# Altium project MOSFET_Four_nodes_network.PrjPcb (part 1 of 2)
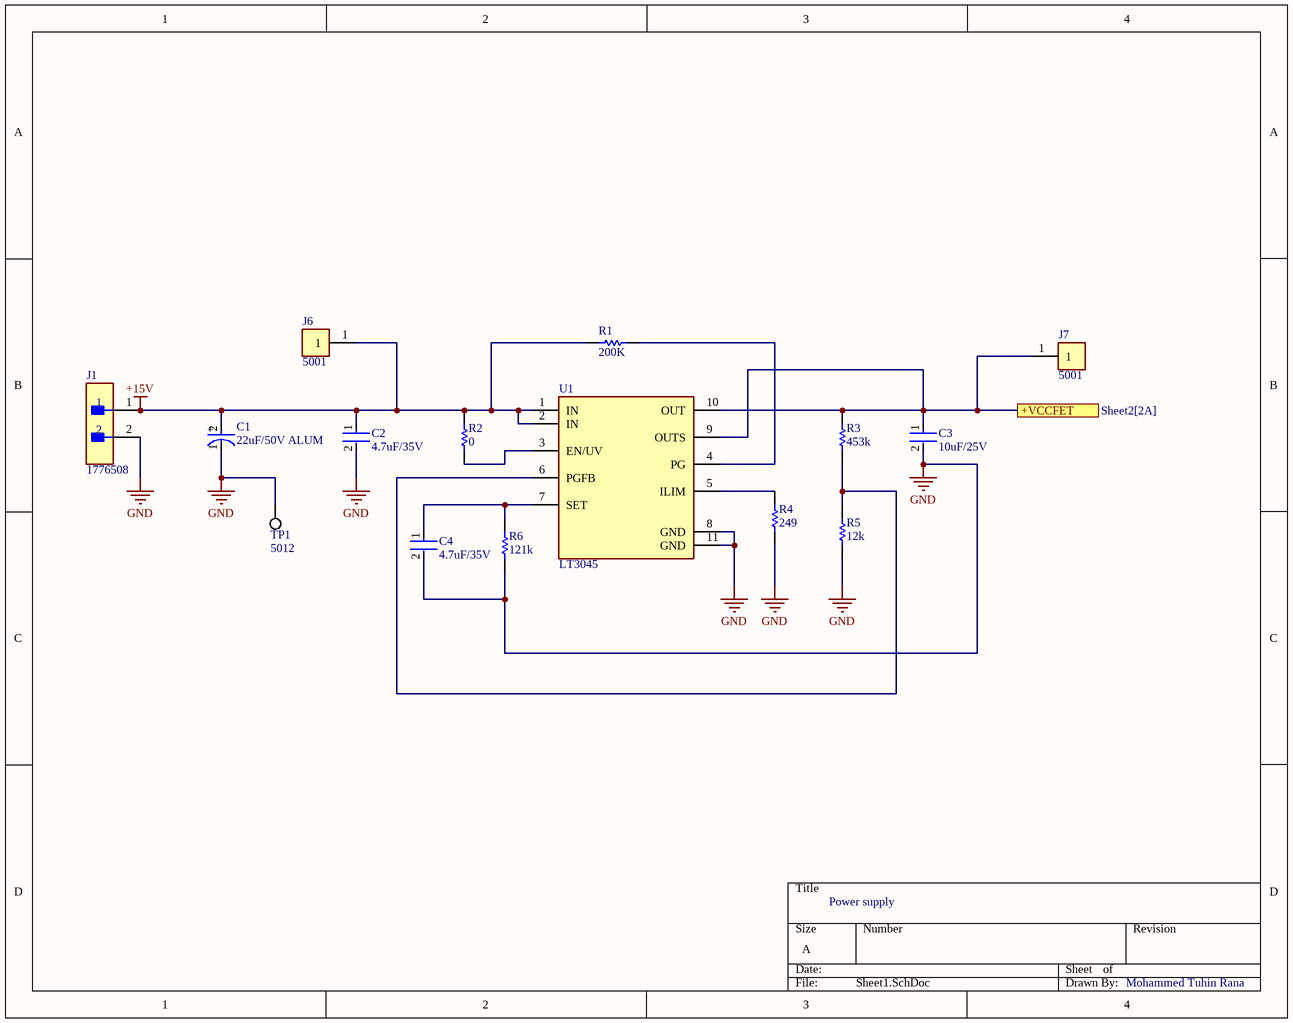
[diagram p0: Sheet1.SchDoc]
10 sheets, 224 parts. Net scope: flat (ports and power ports of the same name join across sheets).
Board file: PCB1.PcbDoc
Sheets:
  Sheet1.SchDoc
  Sheet2.SchDoc
  Sheet3.SchDoc
  Sheet4.SchDoc
  Sheet6.SchDoc
  Sheet5.SchDoc
  Sheet7.SchDoc
  Sheet8.SchDoc
  Sheet9.SchDoc
  Sheet10.SchDoc

## Sheet Sheet1.SchDoc
size A; SheetNumber: 1; SheetTotal: 10

### Parts
C1  22uF/50V ALUM  [FP-FKD-MFG]
C2  4.7uF/35V  [FP-C3216-160-0_2-IPC_C]
C3  10uF/25V  [FP-GRM31C-0_2-e0_3_0_8-MFG]
C4  4.7uF/35V  [FP-C3216-160-0_2-IPC_C]
J1  1776508  [FP-1776508-MFG]
J6  5001  [FP-5001-MFG]
J7  5001  [FP-5001-MFG]
R1  200K  [RESC1005X40X25NL05T05]
R2  0  [RESC2013X70X40NL20T20]
R3  453k  [RESC2013X70X40LL20T20]
R4  249  [RESC2013X70X40NL20T20]
R5  12k  [RESC1005X40X25ML05T05]
R6  121k  [RESC1608X55X30LL15T15]
TP1  5012  [KSTN-5012_V]
U1  LT3045  [FP-LT3045EDD#PBF-MFG]

### Ports
+VCCFET (see Sheet2[2A])

### Nets
+15V: C1.2(A) C2.1 J1.1 J6.1 R1.2 R2.2 U1.1(IN) U1.2(IN)
GND: C1.1(C) C2.2 C3.2 C4.2 J1.2 R4.1 R5.1 R6.1 TP1.1 U1.8(GND) U1.11(GND)
NetC3_1: C3.1 J7.1 R3.2 U1.9(OUTS) U1.10(OUT) ; port +VCCFET
NetC4_1: C4.1 R6.2 U1.7(SET)
NetR1_1: R1.1 U1.4(PG)
NetR2_1: R2.1 U1.3(EN/UV)
NetR3_1: R3.1 R5.2 U1.6(PGFB)
NetR4_2: R4.2 U1.5(ILIM)

### Notes on the sheet
- Power supply
- Mohammed Tuhin Rana
- (in symbol CMP-2000-06209-2) +

### Library data of the parts
C1 = CMP-2000-06209-2: CAP ALUM 22UF 20% 50V SMD; Life (Hours): 2000Hour; Ripple Current: 165mA; ESR (Equivalent Series Resistance): 880mR; Dielectric Material: Aluminium; Leakage Current: 3uA; Polarity: Polar; Radiation Hardening: No; Lead Free: Lead Free; Capacitance: 22uF; Package Quantity: 1000; Width: 7.8mm; Length: 5.8mm; Max Operating Temperature: 105°C; Tolerance: 20%; Height - Seated (Max): 0.24inch; Height: 5.8mm; Voltage Rating: 50V; Diameter: 6.3mm; Series: FK; Voltage: 50V; Termination: SMD/SMT; Construction: Cylindrical; Mount: Surface Mount; Number of Pins: 2; Case/Package: Radial; Packaging: Tape and Reel; Ripple Current (AC): 165mA; REACH SVHC: No SVHC; Min Operating Temperature: -55°C; Contact Plating: Tin; Voltage Rating (DC): 50V; RoHS Compliant: Yes; Impedance: 880mR
C2 C4 = CMP-08246-003663-1: Multilayer Ceramic Capacitors 4.7uF ±10% 35V X7R SMD 1206; Width: 0.063inch; Depth: 1.6mm; Case Code (Metric): 3216; Dielectric: X7R; Case/Package: 1206; Voltage Rating: 35V; Tolerance: 10%; Series: C; Height: 1.6mm; Dielectric Material: Ceramic; Packaging: Tape and Reel; Capacitance: 4.7uF; RoHS Compliant: Yes; Min Operating Temperature: -55°C; Termination: SMD/SMT; Mount: Surface Mount; Voltage Rating (DC): 35V; Package Quantity: 1; Max Operating Temperature: 125°C; Case Code (Imperial): 1206; Length: 3.2mm; Construction: Flat; Lead Free: Lead Free; Thickness: 0.075inch; Weight: 0.000571oz
C3 = CMP-06035-003589-1: Chip Multilayer Ceramic Capacitors for General Purpose, 1206, 10uF, X7R, 15%, 10%, 25V; Case Code (Imperial): 1206; Voltage Rating (DC): 25V; Voltage Rating: 25V; Length: 3.2mm; Lead Free: Lead Free; Thickness: 0.071inch; Package Quantity: 1; Width: 1.6mm; Max Operating Temperature: 125°C; Number of Pins: 2; Height: 1.6mm; Case Code (Metric): 3216; REACH SVHC: No SVHC; Radiation Hardening: No; Case/Package: 1206; Material: Ceramic; Tolerance: 10%; Voltage: 25V; Mount: Surface Mount; Packaging: Tape and Reel; Dielectric: X7R; Termination: SMD/SMT; Min Operating Temperature: -55°C; Capacitance: 10uF; Depth: 1.6mm
J1 = CMP-09399-000017-1: TERM BLOCK HDR 2POS 90DEG 5.08MM; Connector Type: Plug; Number of Positions: 2; Voltage: 300V; Number of Levels: 1; Max Current Rating: 12A; Voltage Rating: 250V; Approvals: CSA; Pitch: 5.08mm; Package Quantity: 50; Contact Material: Tin; Orientation: Right Angle; Packaging: Bulk; Height: 12.1mm; Lead Free: Lead Free; Contact Plating: Tin; Mount: Through Hole; Series: MSTB; Current: 12A; Housing Material: Polybutylene; Color: Green; RoHS Compliant: Yes; Number of Poles: 2; Length: 20.32mm; Weight: 5.396916oz; Number of Rows: 1; Flammability Rating: UL94 V-0; Housing Color: Green; Width: 20.32mm; Current Rating: 12A; Termination: Solder; Number of Positions Per Level: 2; Depth: 12mm; Number of Contacts: 2
J6 J7 = CMP-2000-05181-2: PC TEST POINT MINIATURE BLACK; Body Material: Bronze; Plating: Silver; Inside Diameter: 1.27mm; Hole Diameter: 1.6mm; Number of Ports: 1; Outside Diameter: 2.54mm; Insulation: Insulated; Insulation Material: Nylon; Mount: Through Hole; RoHS Compliant: Yes; Series: THM; Height: 0.3inch; Termination: Through Hole; Material: Nylon; Packaging: Bulk; Contact Material: Bronze; REACH SVHC: No SVHC; Contact Plating: Silver; Orientation: Straight; Lead Free: Lead Free; Package Quantity: 100; Length: 7.62mm; Flammability Rating: UL94 V-0; Number of Contacts: 1; Diameter: 2.54mm; Housing Color: Black; Color: Black
R1 = CMP-1011-00768-4: Chip Resistor, 200 KOhm, +/- 1%, 100 mW, -55 to 155 degC, 0402 (1005 Metric), RoHS, Tape and Reel; PartNumber: ERJ-2RKF2003X; Manufacturer: Basic Passives; Case\/Package: 0402; Voltage Rating: 50 V; Power Rating: 100 mW; RoHSCompliant: true; Length: 1 mm; DatasheetVersion: 04/2015; ComponentLink2URL: http://industrial.panasonic.com/cdbs/www-data/pdf/RDA0000/AOA0000C86.pdf; Mount: Surface Mount; PackageDescription: 2-Pin Surface Mount Device, Body 1 x 0.5 mm; Tolerance: 1%; Width: 0.5 mm; ComponentLink2Description: Datasheet; Packaging: Tape and Reel; REACH SVHC: No SVHC; Min Operating Temperature: -55 degC; Package Quantity: 10000; ComponentLink1Description: Manufacturer URL; Height: 0.35 mm; ComponentLink1URL: http://www.panasonic.com/; Mounting Technology: Surface Mount; Case Code (Imperial): 0402; PackageReference: 0402; Radiation Hardening: No; Pins: 2; Max Operating Temperature: 155 degC; Resistance: 200 KOhm; Case Code (Metric): 1005
R2 = CMP-1665-00002-5: Chip Resistor, 0 Ohm, +/- 1%, 0.125 W, -55 to 155 degC, 0805 (2012 Metric), RoHS, Tape and Reel; PartNumber: ERJ-6GEY0R00V; Tolerance: 5%; Resistance: 0 Ohm; REACH SVHC: No SVHC; Min Operating Temperature: -55 degC; Case/Package: 0805; Packaging: Tape and Reel; Package Quantity: 5000; ComponentLink1Description: Manufacturer URL; PackageDescription: 2-Pin Surface Mount Device, Body 2 x 1.25 mm; Mounting Technology: Surface Mount; Max Operating Temperature: 155 degC; Width: 1.25 mm; RoHSCompliant: True; Height: 0.6 mm; ComponentLink1URL: http://www.panasonic.com/; ComponentLink2URL: http://industrial.panasonic.com/cdbs/www-data/pdf/RDA0000/AOA0000C84.pdf; Case Code (Imperial): 0805; DatasheetVersion: 03/2015; Length: 2 mm; Case Code (Metric): 2012; ComponentLink2Description: Datasheet; Radiation Hardening: No
R3 = CMP-2001-00194-1: Manufacturer: Panasonic; Part Number: ERJ-6ENF4533V
R4 = CMP-2001-00071-1: Part Number: ERJ-6ENF2490V; Manufacturer: Panasonic
R5 = CMP-2002-00646-4: Chip Resistor, 12 KOhm, +/- 1%, 0.1 W, -55 to 155 degC, 0402 (1005 Metric), RoHS, Tape and Reel; PartNumber: ERJ-2RKF1202X; Resistance: 12 KOhm; Voltage Rating: 50 V; Case\/Package: 0402; Power Rating: 100 mW; Length: 1 mm; PackageReference: 0402; DatasheetVersion: 04/2015; ComponentLink2Description: Datasheet; ComponentLink1URL: http://www.panasonic.com/; Pins: 2; Width: 0.5 mm; REACH SVHC: Yes; Packaging: Tape and Reel; Min Operating Temperature: -55 degC; Mounting Technology: Surface Mount; Max Operating Temperature: 155 degC; Case Code (Imperial): 0402; Height: 0.35 mm; Tolerance: 1%; PackageDescription: 2-Pin Surface Mount Device, Body 1 x 0.5 mm; RoHSCompliant: true; ComponentLink1Description: Manufacturer URL; Mount: Surface Mount; ComponentLink2URL: http://industrial.panasonic.com/cdbs/www-data/pdf/RDA0000/AOA0000C86.pdf; Package Quantity: 10000; Case Code (Metric): 1005
R6 = CMP-2000-00221-1: Manufacturer: Panasonic; Part Number: ERJ-3EKF1213V
TP1 = CMP-1672-00004-4: Test Point, White, Through Hole, RoHS, Bulk; Manufacturer: Keystone; DatasheetVersion: Rev. F, 12/2013; ComponentLink1URL: http://www.keyelco.com/; PackageReference: 5012; RoHSCompliant: true; ComponentLink2Description: Datasheet; Colour: White; Contact Material: Bronze; PackageDescription: 1-Pin Through Hole Device, Dia 3.17 mm; Mounting Technology: Through Hole; Mount: Through Hole; Package Quantity: 100; ComponentLink1Description: Manufacturer URL; Pins: 1; Height: 8.12 mm; Packaging: Bulk; REACH SVHC: No SVHC; Contact Plating: Silver; Length: 11.3 mm; ComponentLink2URL: http://www.keyelco.com/product-pdf.cfm?p=1321
U1 = CMP-09138-000240-1: IC REG LINEAR 0V 500MA 10DFN; Min Current Limit: 570mA; Number of Regulators: 1; Dropout Voltage: 260mV; Output Voltage: 15V; RoHS Compliant: Yes; Series: -; Output Current: 500mA; Case/Package: DFN; Max Operating Temperature: 125°C; Min Operating Temperature: -40°C

## Sheet Sheet2.SchDoc
size A; SheetNumber: 2; SheetTotal: 10
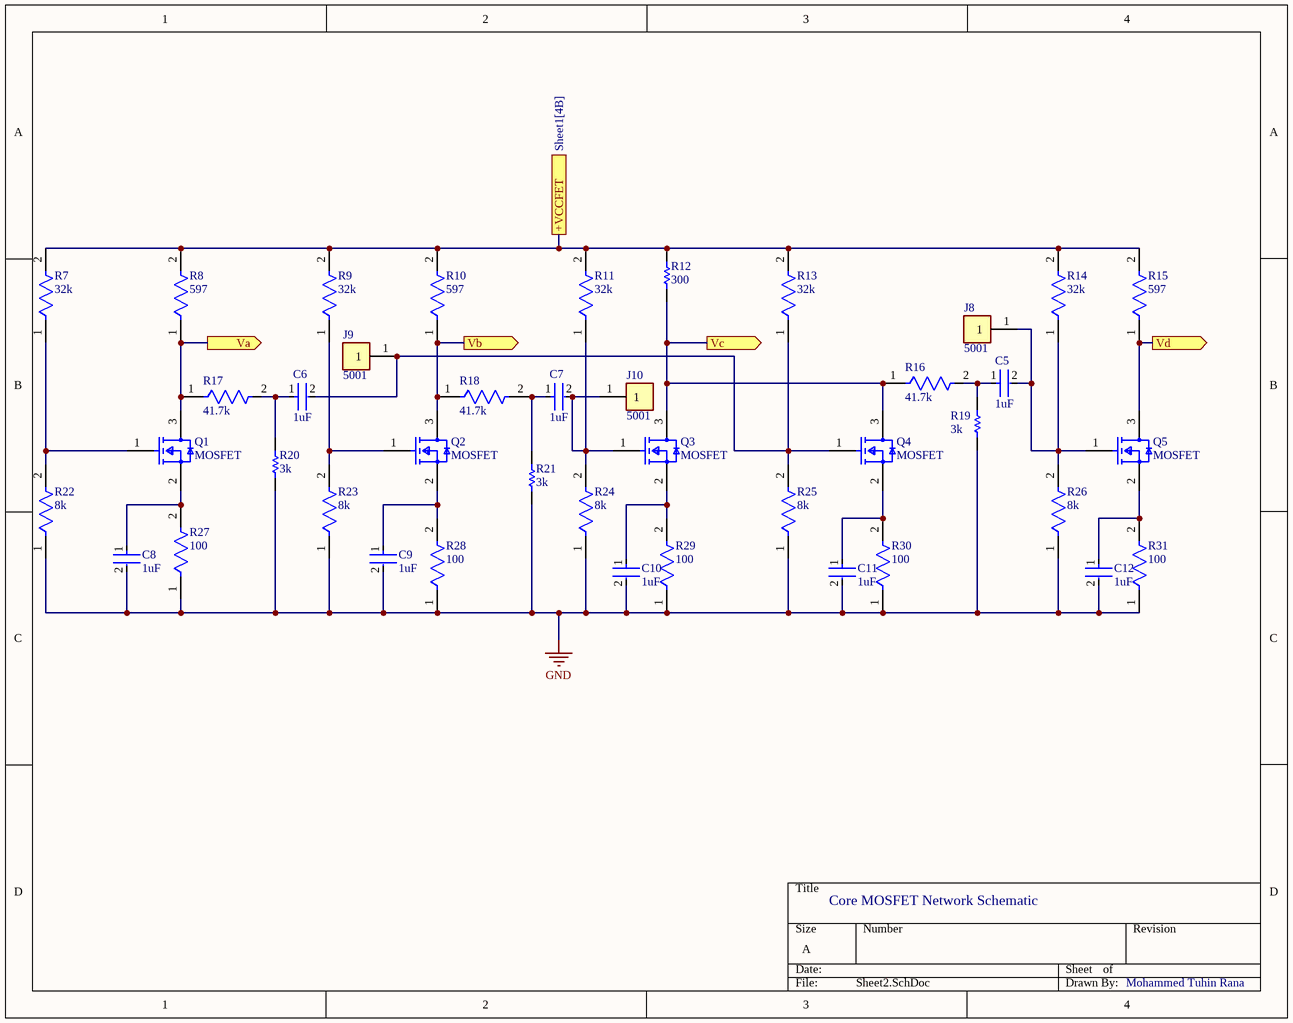
[diagram p1: Sheet2.SchDoc]

### Parts
C5  1uF  [FP-CL10-IPC_C]
C6  1uF  [FP-CL10-IPC_C]
C7  1uF  [FP-CL10-IPC_C]
C8  1uF  [FP-CL10-IPC_C]
C9  1uF  [FP-CL10-IPC_C]
C10  1uF  [FP-CL10-IPC_C]
C11  1uF  [FP-CL10-IPC_C]
C12  1uF  [FP-CL10-IPC_C]
J8  5001  [FP-5001-MFG]
J9  5001  [FP-5001-MFG]
J10  5001  [FP-5001-MFG]
Q1  MOSFET  [FP-318-08-IPC_B]
Q2  MOSFET  [FP-318-08-IPC_A]
Q3  MOSFET  [FP-318-08-IPC_A]
Q4  MOSFET  [FP-318-08-IPC_A]
Q5  MOSFET  [FP-318-08-IPC_A]
R7  32k  [FP-RT0603-0_55-MFG]
R8  597  [FP-RN73R2B-MFG]
R9  32k  [FP-RT0603-0_55-MFG]
R10  597  [FP-RN73R2B-MFG]
R11  32k  [FP-RT0603-0_55-MFG]
R12  300  [RESC3225X70X50ML20T20]
R13  32k  [FP-RT0603-0_55-MFG]
R14  32k  [FP-RT0603-0_55-MFG]
R15  597  [FP-RN73R2B-MFG]
R16  41.7k  [FP-RN73R1J-MFG]
R17  41.7k  [FP-RN73R1J-MFG]
R18  41.7k  [FP-RN73R1J-MFG]
R19  3k  [RESC1608X55X25ML10T15]
R20  3k  [RESC1608X55X25ML10T15]
R21  3k  [RESC1608X55X25ML10T15]
R22  8k  [FP-RT0603-0_55-MFG]
R23  8k  [FP-RT0603-0_55-MFG]
R24  8k  [FP-RT0603-0_55-MFG]
R25  8k  [FP-RT0603-0_55-MFG]
R26  8k  [FP-RT0603-0_55-MFG]
R27  100  [FP-ERA3A-IPC_B]
R28  100  [FP-ERA3A-IPC_B]
R29  100  [FP-ERA3A-IPC_B]
R30  100  [FP-ERA3A-IPC_B]
R31  100  [FP-ERA3A-IPC_B]

### Ports
+VCCFET (see Sheet1[4B]), Va (out, see Sheet3[1A]), Vb (out, see Sheet4[1A]), Vc (out, see Sheet6[1A]), Vd (out, see Sheet5[1A])

### Nets
GND: C8.2 C9.2 C10.2 C11.2 C12.2 R19.1 R20.1 R21.1 R22.1 R23.1 R24.1 R25.1 R26.1 R27.1 R28.1 R29.1 R30.1 R31.1
NetC3_1: R7.2 R8.2 R9.2 R10.2 R11.2 R12.2 R13.2 R14.2 R15.2 ; port +VCCFET
NetC5_1: C5.1 R16.2 R19.2
NetC5_2: C5.2 J8.1 Q5.1(Gate) R14.1 R26.2
NetC6_1: C6.1 R17.2 R20.2
NetC6_2: C6.2 J9.1 Q4.1(Gate) R13.1 R25.2
NetC7_1: C7.1 R18.2 R21.2
NetC7_2: C7.2 J10.1 Q3.1(Gate) R11.1 R24.2
NetC8_1: C8.1 Q1.2(Source) R27.2
NetC9_1: C9.1 Q2.2(Source) R28.2
NetC10_1: C10.1 Q3.2(Source) R29.2
NetC11_1: C11.1 Q4.2(Source) R30.2
NetC12_1: C12.1 Q5.2(Source) R31.2
NetQ1_1: Q1.1(Gate) R7.1 R22.2
NetQ1_3: Q1.3(Drain) R8.1 R17.1 ; port Va
NetQ2_1: Q2.1(Gate) R9.1 R23.2
NetQ2_3: Q2.3(Drain) R10.1 R18.1 ; port Vb
NetQ3_3: Q3.3(Drain) Q4.3(Drain) R12.1 R16.1 ; port Vc
NetQ5_3: Q5.3(Drain) R15.1 ; port Vd

### Notes on the sheet
- Core MOSFET Network Schematic
- Mohammed Tuhin Rana

### Library data of the parts
C5-C12 = CMP-13271-004127-1: Cap Ceramic 1uF 25V X5R ±10% Pad SMD 0603 +85°C T/R; Height: 0.8mm; Capacitance: 1uF; Depth: 0.8mm; Package Quantity: 1; Mount: Surface Mount; Contact Plating: Tin; Voltage Rating: 25V; Dielectric: X5R; Packaging: Tape and Reel; Material: Ceramic; Case Code (Metric): 1608; Length: 1.6mm; Voltage: 25V; Min Operating Temperature: -55°C; Width: 0.031inch; Tolerance: 10%; Case/Package: 0603; Radiation Hardening: No; Case Code (Imperial): 0603; Thickness: 0.035inch; Lead Free: Lead Free; Max Operating Temperature: 85°C; Voltage Rating (DC): 25V
J8-J10 = CMP-2000-05181-2: as J6 on sheet Sheet1; Insulation Material: Nylon; Mount: Through Hole; RoHS Compliant: Yes; Series: THM; Height: 0.3inch; Termination: Through Hole; Material: Nylon; Packaging: Bulk; Contact Material: Bronze; REACH SVHC: No SVHC; Contact Plating: Silver; Orientation: Straight; Lead Free: Lead Free; Package Quantity: 100; Length: 7.62mm; Flammability Rating: UL94 V-0; Number of Contacts: 1; Diameter: 2.54mm; Housing Color: Black; Color: Black
Q1-Q5 = CMP-1058-00769-2: MOSFET N-CH 60V 260MA SOT-23; On-State Resistance: 2.5R; Turn-Off Delay Time: 4.8ns; Nominal Vgs: 1V; Element Configuration: Single; Rise Time: 1.2ns; Input Capacitance: 26.7pF; Number of Elements: 1; Turn-On Delay Time: 1.7ns; Gate to Source Voltage (Vgs): 20V; Max Power Dissipation: 300mW; Drain to Source Breakdown Voltage: 60V; Max Operating Temperature: 150°C; REACH SVHC: No SVHC; Case/Package: SOT-23-3; Lead Free: Lead Free; Length: 2.9mm; Height: 0.94mm; Package Quantity: 3000; Min Operating Temperature: -55°C; Radiation Hardening: No; Packaging: Tape and Reel; Fall Time: 1.2ns; Drain to Source Resistance: 2.5R; Halogen Free: Halogen Free; Threshold Voltage: 1V; Number of Pins: 3; Continuous Drain Current (ID): 260mA; Rds On Max: 2.5R; Power Dissipation: 300mW; Width: 1.3mm
R7 R9 R11 R13 R14 = CMP-00621-34935746-1: RT0603BRD0732KL High Precision-High Stability Chip Resistor Thin Film 0603 32kOhm 0.1% Paper T/R; Resistance: 32kΩ; Temperature Coefficient: 25ppm/°C; Max Power Dissipation: 100mW; Case/Package: 0603; Composition: Thin Film; Features: Moisture Resistant; Packaging: Tape & Reel; RoHS: Compliant; Height: 558.8µm; Max Operating Temperature: 155°C; NexarPartId: 34935746; Number of Terminations: 2; Length: 1.6002mm; Width: 787.4µm; Tolerance: 0.1%; Min Operating Temperature: -55°C
R8 R10 R15 = CMP-04015-006526-1: 597Ω ±0.1% 0.25W, 1/4W Chip Resistor 1206 (3216 Metric) Moisture Resistant Thin Film
R12 = CMP-2005-03919-1: Manufacturer: Panasonic; Part Number: ERJP14F3000U
R16-R18 = CMP-04015-068438-1: 41.7kΩ ±1% 0.1W, 1/10W Chip Resistor 0603 (1608 Metric) Moisture Resistant Thin Film
R19-R21 = CMP-2000-04454-1: Part Number: RT0603BRD073KL; Manufacturer: Yageo
R22-R26 = CMP-00621-71394448-1: RT0603BRE078KL SMD Chip Resistor, 8 kOhm, ± 0.1%, 100 mW, 0603 [1608 Metric], Thin Film, High Precision High Stability; Power Rating: 100mW; Voltage Rating: 75V; Temperature Coefficient: 50ppm/°C; Resistance: 8kΩ; NexarPartId: 71394448; Number of Terminations: 2; Features: Moisture Resistant; Min Operating Temperature: -55°C; Height: 550µm; Case/Package: 0603; Max Operating Temperature: 155°C; Packaging: Tape & Reel; Tolerance: 0.1%; Length: 1.6002mm; Max Power Dissipation: 100mW; RoHS: Compliant; Composition: Thin Film; Width: 787.4µm
R27-R31 = CMP-2000-00870-2: RES SMD 100 OHM 0.1% 1/10W 0603; Voltage Rating: 75V; Power Rating: 100mW; Resistance: 100R; Temperature Coefficient: 25ppm/°C; Number of Terminations: 2; Case/Package: 0603; Termination: SMD/SMT; Number of Pins: 2; Size Code: 0603; Length: 1.6mm; Min Operating Temperature: -55°C; Resistor Type: Thin Film; Depth: 0.8mm; Military Standard: Not; Packaging: Tape and Reel; RoHS Compliant: Yes; Construction: Rectangular; Resistance Tolerance: 0.1%; Contact Plating: Tin; Width: 0.8mm; Mount: Surface Mount; Case Code (Metric): 1608; Max Operating Temperature: 155°C; Height: 0.45mm; Case Code (Imperial): 0603; Series: ERA-3A; Package Quantity: 5000; REACH SVHC: No SVHC; Tolerance: 0.1%; Max Power Dissipation: 100mW; Radiation Hardening: No; Technology: METAL FILM

## Sheet Sheet3.SchDoc
size A; SheetNumber: 3; SheetTotal: 10
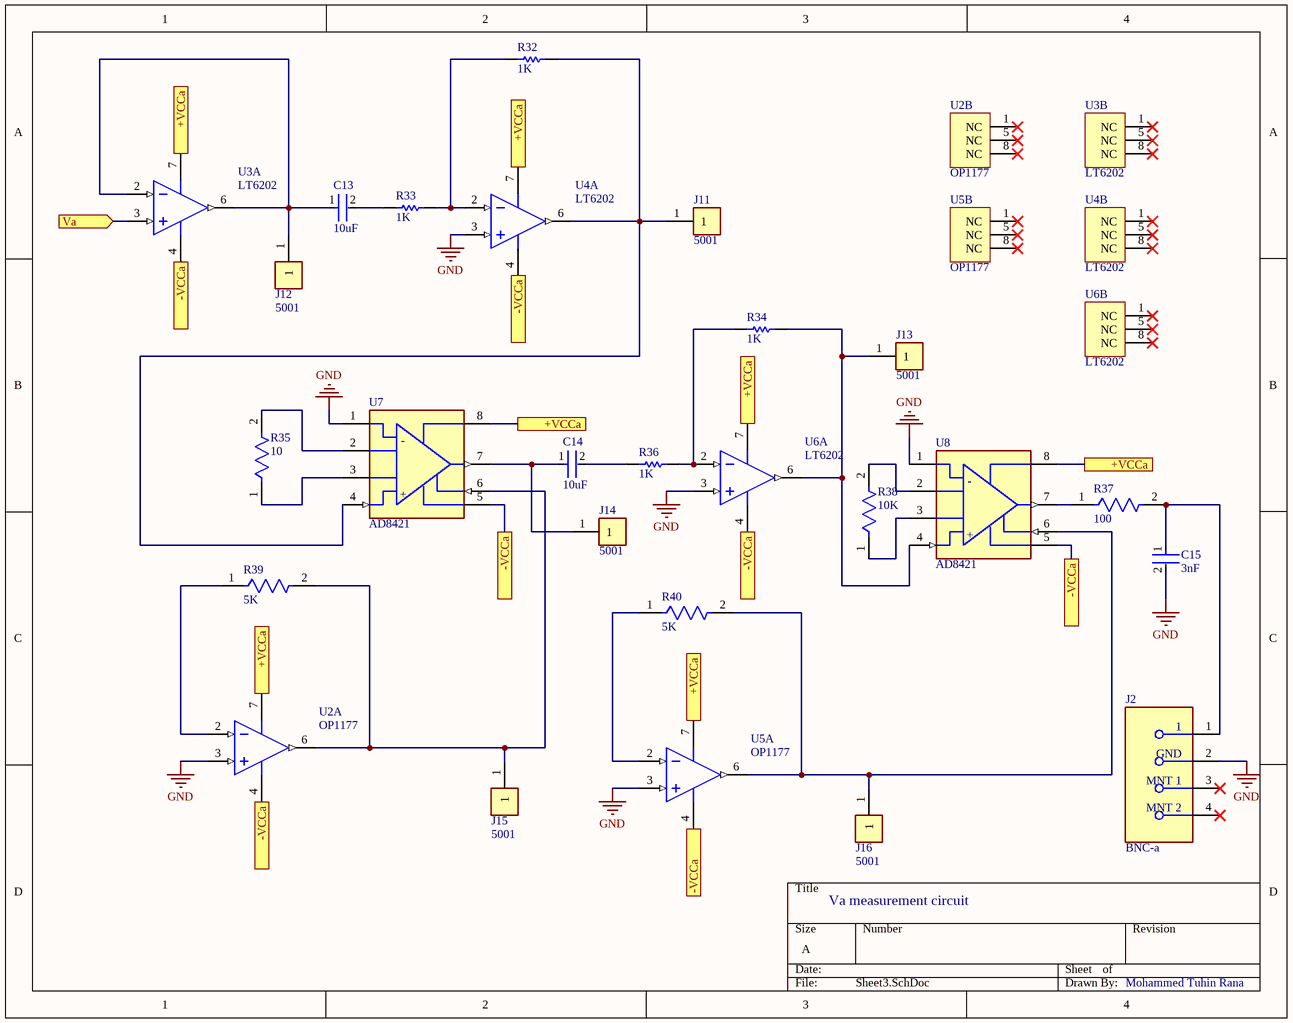
[diagram p2: Sheet3.SchDoc]

### Parts
C13  10uF  [FP-GRM21B-0_1-IPC_C]
C14  10uF  [FP-GRM21B-0_1-IPC_C]
C15  3nF  [FP-C1206C-EB-MFG]
J2  BNC-a  [FP-5413194-2-MFG]
J11  5001  [FP-5001-MFG]
J12  5001  [FP-5001-MFG]
J13  5001  [FP-5001-MFG]
J14  5001  [FP-5001-MFG]
J15  5001  [FP-5001-MFG]
J16  5001  [FP-5001-MFG]
R32  1K  [RESC3216X70X50ML20T25]
R33  1K  [RESC3216X70X50ML20T25]
R34  1K  [RESC3216X70X50ML20T25]
R35  10  [FP-RT0603-MFG]
R36  1K  [RESC3216X70X50ML20T25]
R37  100  [FP-ERA3A-IPC_B]
R38  10K  [FP-ERJPA3-IPC_A]
R39  5K  [FP-RT1206-0_65-MFG]
R40  5K  [FP-RT1206-0_65-MFG]
U2  OP1177  [ADI-R-8_N]  (parts A,B of 2)
U3  LT6202  [LT-S8-8_N]  (parts A,B of 2)
U4  LT6202  [LT-S8-8_N]  (parts A,B of 2)
U5  OP1177  [ADI-R-8_N]  (parts A,B of 2)
U6  LT6202  [LT-S8-8_N]  (parts A,B of 2)
U7  AD8421  [FP-R-8-IPC_C]
U8  AD8421  [FP-R-8-IPC_C]

### Ports
+VCCa (see Sheet3[1A], Sheet3[1C], Sheet3[2A], Sheet3[2B], Sheet3[3B], Sheet3[3C], Sheet7[4B]), +VCCa (see Sheet3[1A], Sheet3[1C], Sheet3[2A], Sheet3[2B], Sheet3[3B], Sheet3[4B], Sheet7[4B]), +VCCa (see Sheet3[1A], Sheet3[1C], Sheet3[2A], Sheet3[2B], Sheet3[3C], Sheet3[4B], Sheet7[4B]), +VCCa (see Sheet3[1A], Sheet3[1C], Sheet3[2A], Sheet3[3B], Sheet3[3C], Sheet3[4B], Sheet7[4B]), +VCCa (see Sheet3[1A], Sheet3[1C], Sheet3[2B], Sheet3[3B], Sheet3[3C], Sheet3[4B], Sheet7[4B]), +VCCa (see Sheet3[1A], Sheet3[2A], Sheet3[2B], Sheet3[3B], Sheet3[3C], Sheet3[4B], Sheet7[4B]), +VCCa (see Sheet3[1C], Sheet3[2A], Sheet3[2B], Sheet3[3B], Sheet3[3C], Sheet3[4B], Sheet7[4B]), -VCCa (see Sheet3[1B], Sheet3[1D], Sheet3[2B], Sheet3[2C], Sheet3[3C], Sheet3[3D], Sheet7[3B]), -VCCa (see Sheet3[1B], Sheet3[1D], Sheet3[2B], Sheet3[2C], Sheet3[3C], Sheet3[4C], Sheet7[3B]), -VCCa (see Sheet3[1B], Sheet3[1D], Sheet3[2B], Sheet3[2C], Sheet3[3D], Sheet3[4C], Sheet7[3B]), -VCCa (see Sheet3[1B], Sheet3[1D], Sheet3[2B], Sheet3[3C], Sheet3[3D], Sheet3[4C], Sheet7[3B]), -VCCa (see Sheet3[1B], Sheet3[1D], Sheet3[2C], Sheet3[3C], Sheet3[3D], Sheet3[4C], Sheet7[3B]), -VCCa (see Sheet3[1B], Sheet3[2B], Sheet3[2C], Sheet3[3C], Sheet3[3D], Sheet3[4C], Sheet7[3B]), -VCCa (see Sheet3[1D], Sheet3[2B], Sheet3[2C], Sheet3[3C], Sheet3[3D], Sheet3[4C], Sheet7[3B]), Va (in, see Sheet2[1B])

### Nets
GND: C15.2 J2.2(GND) U2.3(+IN) U4.3(+IN) U5.3(+IN) U6.3(+IN) U7.1(-IN) U8.1(-IN)
NetC13_1: C13.1 J12.1 U3.2(-IN) U3.6(OUT)
NetC13_2: C13.2 R33.1
NetC14_1: C14.1 J14.1 U7.7(VOUT)
NetC14_2: C14.2 R36.1
NetC15_1: C15.1 J2.1 R37.2
NetC27_1: U2.7(+V) U3.7(V+) U4.7(V+) U5.7(+V) U6.7(V+) U7.8(+VS) U8.8(+VS) ; port +VCCa
NetC28_1: U2.4(-V) U3.4(V-) U4.4(V-) U5.4(-V) U6.4(V-) U7.5(-VS) U8.5(-VS) ; port -VCCa
NetJ11_1: J11.1 R32.2 U4.6(OUT) U7.4(+IN)
NetJ13_1: J13.1 R34.2 U6.6(OUT) U8.4(+IN)
NetJ15_1: J15.1 R39.2 U2.6(OUT) U7.6(REF)
NetJ16_1: J16.1 R40.2 U5.6(OUT) U8.6(REF)
NetQ1_3: U3.3(+IN) ; port Va
NetR32_1: R32.1 R33.2 U4.2(-IN)
NetR34_1: R34.1 R36.2 U6.2(-IN)
NetR35_1: R35.1 U7.3(2_RG)
NetR35_2: R35.2 U7.2(1_RG)
NetR37_1: R37.1 U8.7(VOUT)
NetR38_1: R38.1 U8.3(2_RG)
NetR38_2: R38.2 U8.2(1_RG)
NetR39_1: R39.1 U2.2(-IN)
NetR40_1: R40.1 U5.2(-IN)

Not connected (* = marked no-connect by the designer): J2 3(MNT_1)* 4(MNT_2)*; U2 1(NC)* 5(NC)* 8(NC)*; U3 1(NC)* 5(NC)* 8(NC)*; U4 1(NC)* 5(NC)* 8(NC)*; U5 1(NC)* 5(NC)* 8(NC)*; U6 1(NC)* 5(NC)* 8(NC)*

### Notes on the sheet
- Va measurement circuit
- Mohammed Tuhin Rana
- (in symbol CMP-09116-000012-1) -; +

### Library data of the parts
C13 C14 = CMP-2007-03453-2: Chip Multilayer Ceramic Capacitors for General Purpose, 0805, 10uF, X5R, 15%, 10%, 16V; Radiation Hardening: No; Thickness: 0.053inch; Voltage Rating (DC): 16V; Lead Free: Lead Free; Package Quantity: 1; Width: 1.25mm; Case Code (Imperial): 0805; Depth: 1.25mm; Packaging: Tape and Reel; Dielectric: X5R; Max Operating Temperature: 85°C; Tolerance: 10%; Voltage Rating: 16V; Voltage: 16V; Capacitance: 10uF; Height: 1.25mm; Case Code (Metric): 2012; Material: Ceramic; Mount: Surface Mount; Case/Package: 0805; REACH SVHC: No SVHC; Length: 2mm; Min Operating Temperature: -55°C; Termination: SMD/SMT
C15 = CMP-1037-02920-2: CAP CER 3000PF 50V NP0 1206; Manufacturer Part Number: C1206C302J5GACTU; Manufacturer: KEMET; Value: 3,000 pF; Temperature Coefficient: 15%; Tolerance: 0.05; Material: Ceramic; Automotive Grade: Grade 0; Temperature Characteristic: C0G; ComponentLink2URL: https://content.kemet.com/datasheets/KEM_C1007_X8R_ULTRA_150C_SMD.pdf; Device Class L3: Ceramic Capacitors; Device Class L2: Capacitors; ComponentLink2Description: Datasheet; Automotive: Yes; Temperature Range Low: -55°C; Temperature: -55°C to +150°C; Octopart: https://octopart.com/c1206c302j5gactu-kemet-12776246; Height: 0.88mm; Lead Free: Yes; Device Class L1: Passive Components; Digikey Description: CAP CER 3000PF 50V NP0 1206; Category: Cap; Mouser Description: Capacitor, Ceramic, 3Nf, 50Vdc, 5-% Tol, 5+% Tol, C0g-Tc Code, -30, 30Ppm-Tc Rohs Compliant: Yes; RoHS: TRUE; Ipc Land Pattern Name: CAPC320160X78; Voltage Rating: 50 V; Capacitance: 3,000 pF; Temperature Range High: +150°C; Package: C1206C-EB
J2 = CMP-03790-39547162-1: 5413194-2 RF BNC Connector, 1 Contact(s), Female, Panel Mount, Solder Terminal, Locking, Jack; Manufacturer Lifecycle Status: ACTIVE; Impedance: 75Ω; Number of Positions: 1; Outside Diameter: 14.529mm; Polarity: Normal, Standard; Sealable: No; Dielectric Material: Polymethylpentene; PCB Mounting Orientation: Right Angle; Voltage Rating: 500V; Body Plating: Nickel; Frequency: 2GHz; Tail Length: 4.11mm; Insulation Resistance: 5GΩ; Body Material: Zinc; ELV: Compliant; Lead Free: Lead Free; Radiation Hardening: No; Gender: Female; Color: Black; Mount: Panel, Through Hole; Packaging: Bulk; NexarPartId: 39547162; Housing Color: Black; Fastening Type: Bayonet; Contact Gender: Female; Lifecycle Status: Production; Depth: 34.93mm; Min Operating Temperature: -55°C; Number of Contacts: 1; RoHS: Compliant; Length: 14.76mm; Insulation Material: Polymethylpentene; Termination: Solder, Through Hole; Connector Type: BNC; Contact Plating: Gold; Max Frequency: 2GHz; Max Operating Temperature: 85°C; Height: 13.18mm; REACH SVHC: Unknown; Orientation: Right Angle; Contact Material: Copper
J11-J16 = CMP-2000-05181-2: as J6 on sheet Sheet1; Insulation Material: Nylon; Mount: Through Hole; RoHS Compliant: Yes; Series: THM; Height: 0.3inch; Termination: Through Hole; Material: Nylon; Packaging: Bulk; Contact Material: Bronze; REACH SVHC: No SVHC; Contact Plating: Silver; Orientation: Straight; Lead Free: Lead Free; Package Quantity: 100; Length: 7.62mm; Flammability Rating: UL94 V-0; Number of Contacts: 1; Diameter: 2.54mm; Housing Color: Black; Color: Black
R32-R34 R36 = CMP-2003-04406-1: Part Number: ERA8AEB102V; Manufacturer: Panasonic
R35 = CMP-2000-04347-2: RES SMD 10 OHM 0.1% 1/10W 0603; Manufacturer: Yageo; Manufacturer Part Number: RT0603BRD0710RL; Resistance: 10Ω; Temperature Coefficient: 25 ppm/°C; Power Rating: 0.1W; Tolerance: 0.001; Voltage Rating: 75V; Value: 10Ω; Height: 0.55mm; Temperature Range Low: -55°C; Temperature Range High: +155°C; Package: RT0603; Digikey Description: RES SMD 10 OHM 0.1% 1/10W 0603; Lead Free: Yes; Ipc Land Pattern Name: RESC16080X45; Mouser Description: Thin Film Resistors - SMD 1/10W 10 ohm .1% 25ppm; Automotive: No; Footprint Url: http://www.yageo.com/exep/pages/download/literatures/PYu-R_Mount_10.pdf; Series: RT; Device Class L3: Chip SMD Resistors; Device Class L2: Resistors; Octopart: https://octopart.com/rt0603brd0710rl-yageo-1216748; Temperature: -55°C to +155°C; Composition: Thin Film; Category: Res; ComponentLink2Description: Datasheet; Device Class L1: Passive Components; RoHS: TRUE; ComponentLink2URL: http://www.yageo.com/documents/recent/PYu-RT_1-to-0.01_RoHS_L_9.pdf
R37 = CMP-2000-00870-2: as R27 on sheet Sheet2; Number of Terminations: 2; Case/Package: 0603; Termination: SMD/SMT; Number of Pins: 2; Size Code: 0603; Length: 1.6mm; Min Operating Temperature: -55°C; Resistor Type: Thin Film; Depth: 0.8mm; Military Standard: Not; Packaging: Tape and Reel; RoHS Compliant: Yes; Construction: Rectangular; Resistance Tolerance: 0.1%; Contact Plating: Tin; Width: 0.8mm; Mount: Surface Mount; Case Code (Metric): 1608; Max Operating Temperature: 155°C; Height: 0.45mm; Case Code (Imperial): 0603; Series: ERA-3A; Package Quantity: 5000; REACH SVHC: No SVHC; Tolerance: 0.1%; Max Power Dissipation: 100mW; Radiation Hardening: No; Technology: METAL FILM
R38 = CMP-05422-000155-1: RES SMD 10K OHM 1% 1/3W 0603; RoHS Compliant: Yes
R39 R40 = CMP-03412-001731-1: RES SMD 5K OHM 0.1% 1/4W 1206; Manufacturer: Yageo; Manufacturer Part Number: RT1206BRD075KL; Resistance: 5kΩ; Value: 5kΩ; Power Rating: 0.25W; Voltage Rating: 200V; Temperature Coefficient: 25ppm/°C; Series: RT; Mouser Description: Thin Film Resistors - SMD 1/4W 5K ohm .1% 25ppm; Temperature: -55°C to +155°C; Composition: Thin Film; Footprint Url: https://www.yageo.com/upload/website/yageo_PYu-R_Mount_10_19050818_343.pdf; Device Class L1: Passive Components; Temperature Range High: +155°C; Octopart: https://octopart.com/rt1206brd075kl-yageo-29806230; Ipc Land Pattern Name: RESC310160X55; Device Class L3: Chip SMD Resistors; Temperature Range Low: -55°C; Height: 0.65mm; ComponentLink2URL: https://www.yageo.com/upload/media/product/productsearch/datasheet/rchip/PYu-RT_1-to-0.01_RoHS_L_11.pdf; Automotive: No; Category: Res; ComponentLink2Description: Datasheet; Package: RT1206-0.65; Lead Free: Yes; Digikey Description: RES SMD 5K OHM 0.1% 1/4W 1206; Device Class L2: Resistors; RoHS: TRUE; Tolerance: 0.1%
U2 U5 = CMP-0384-00640-2: Single Channel Wide Bandwidth Operational Amplifier, 1.3 MHz BW, 700 mV/us SR, Industrial, 8-pin SOIC (R-8), Reel; PartNumber: OP1177ARZ-REEL7; Manufacturer: Analog Devices; Iq/Amp: 500uA; V Span Max: 36V; Input Bias Current: 500pA; Amplifiers Per Package: 1; Small Signal Bandwidth: 1.3MHz; V Span Min: 5V; Input Offset Voltage: 15uV; ComponentLink2Description: Datasheet; ComponentLink4URL: http://www.analog.com/en/all-operational-amplifiers-op-amps/operational-amplifiers-op-amps/op1177/products/product.html#product-recommendations; ComponentLink3Description: Package Specification; PackageDescription: 8-Pin Standard Small Outline Package, Body 3.9 x 4.9 mm, Pitch 1.27 mm; ComponentLink1URL: http://www.analog.com/en/index.html; PackageReference: R-8; PackageVersion: 060506-A; DatasheetVersion: Rev. G; ComponentLink4Description: Reference Circuit; ComponentLink1Description: Manufacturer URL; Mounting Technology: Surface Mount; RevisionNote: Reference Circuit URL fixed; ComponentLink3URL: http://www.analog.com/static/imported-files/packages/PKG_PDF/SOIC_Narrow%20(R)/R_8.pdf; Code_JEDEC: MS-012-AA; Slew Rate: 700mV/us; ComponentLink2URL: http://www.analog.com/static/imported-files/data_sheets/OP1177_2177_4177.pdf; Generic Part Number: OP1177
U3 U4 U6 = CMP-0359-02644-2: Single Channel, Low Noise, High Speed Operational Amplifier, RRIO, 100 MHz Typical GBW, 25 V/us Typical SR, 2.5 to 12.6 V, 8-Pin SOIC (S8-8), Commercial, Pb-Free; Manufacturer: Linear Technology; PartNumber: LT6202CS8#PBF; Channels (#): 1; Vs Min (V): 2.5; Is (mA) Typical: 2.8; Vos (mV) Typical: 0.1; Vos (mV) Guaranteed: 0.5; GBW (MHz) Typical: 100; Vs Max (V): 12.6; SR (V/us) Typical: 25; RevisionNote: URLs updated; ComponentLink2URL: http://cds.linear.com/docs/en/datasheet/620234fd.pdf; PackageDescription: 8-Pin Plastic Small Outline, Body 4.9 x 3.9 mm, Pitch 1.27 mm; Linear Technology Part Number: LT6202; RoHS: Pb-Free; ComponentLink3Description: Package Specification; ComponentLink2Description: Datasheet; PackageVersion: Rev G; ComponentLink3URL: http://cds.linear.com/docs/en/packaging/05081610_G_SO8.pdf; ComponentLink1Description: Manufacturer URL; DatasheetVersion: Rev. D; PackageReference: LT-S8-8; Mounting Technology: Surface Mount; ComponentLink1URL: http://www.linear.com/; Type: VFB
U7 U8 = CMP-09116-000012-1: IC OPAMP INSTR 10MHZ 8SOIC; Manufacturer: Analog Devices; Manufacturer Part Number: AD8421ARZ-R7; Number Of Channels: 1; Min Supply Voltage: 5V; Max Dual Supply Voltage: 18V; Input Offset Voltage: 0.07mV; Standoff Height: 0.1mm; Min Dual Supply Voltage: 2.5V; Nominal Supply Current: 2mA; Max Supply Voltage: 36V; Input Bias Current: 0.001uA; Max Junction Temp: +150°C; Lead Free: Yes; Temperature: -40°C to +85°C; Device Class L1: Integrated Circuits (ICs); Temperature Range Low: -40°C; Automotive: No; RoHS: TRUE; Bandwidth: 10MHz; Package: R-8; Temperature Range High: +85°C; Octopart: https://octopart.com/ad8421arz-r7-analog+devices-21054779; Digikey Description: IC OPAMP INSTR 10MHZ 8SOIC; Device Class L2: Linear ICs; ComponentLink2Description: Datasheet; Category: IC; ComponentLink2URL: https://www.analog.com/media/en/technical-documentation/data-sheets/AD8421.pdf; Height: 1.75mm; Mouser Description: Instrumentation Amplifiers 3nV/Hz Low Power; Device Class L3: Instrumentation

## Sheet Sheet4.SchDoc
size A; SheetNumber: 4; SheetTotal: 10
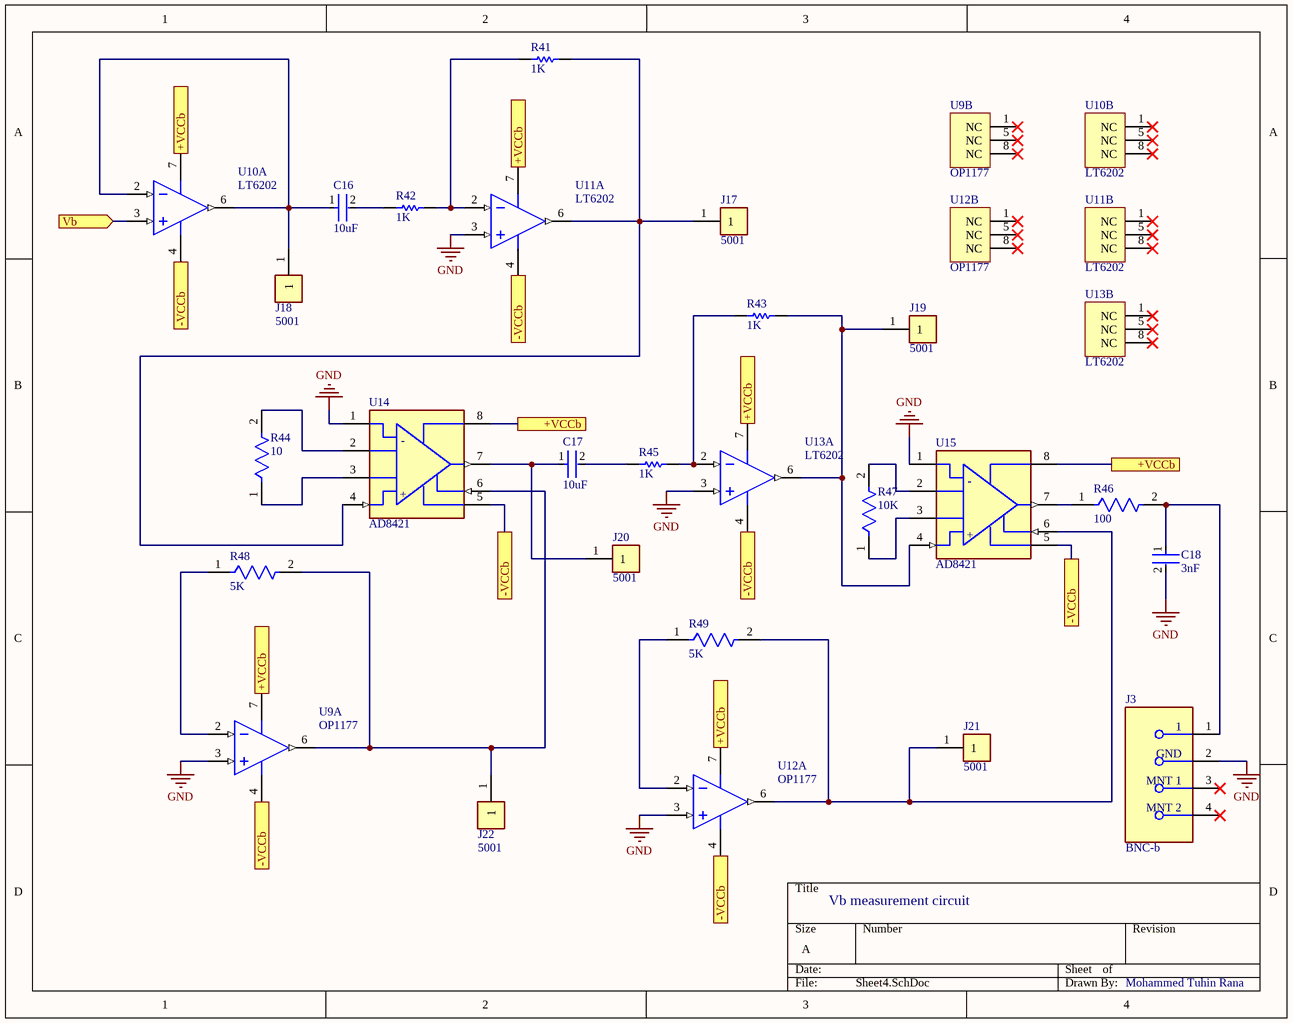
[diagram p3: Sheet4.SchDoc]

### Parts
C16  10uF  [FP-GRM21B-0_1-IPC_C]
C17  10uF  [FP-GRM21B-0_1-IPC_C]
C18  3nF  [FP-C1206C-EB-MFG]
J3  BNC-b  [FP-5413194-2-MFG]
J17  5001  [FP-5001-MFG]
J18  5001  [FP-5001-MFG]
J19  5001  [FP-5001-MFG]
J20  5001  [FP-5001-MFG]
J21  5001  [FP-5001-MFG]
J22  5001  [FP-5001-MFG]
R41  1K  [RESC3216X70X50ML20T25]
R42  1K  [RESC3216X70X50ML20T25]
R43  1K  [RESC3216X70X50ML20T25]
R44  10  [FP-RT0603-MFG]
R45  1K  [RESC3216X70X50ML20T25]
R46  100  [FP-ERA3A-IPC_B]
R47  10K  [FP-ERJPA3-IPC_A]
R48  5K  [FP-RT1206-0_65-MFG]
R49  5K  [FP-RT1206-0_65-MFG]
U9  OP1177  [ADI-R-8_N]  (parts A,B of 2)
U10  LT6202  [LT-S8-8_N]  (parts A,B of 2)
U11  LT6202  [LT-S8-8_N]  (parts A,B of 2)
U12  OP1177  [ADI-R-8_N]  (parts A,B of 2)
U13  LT6202  [LT-S8-8_N]  (parts A,B of 2)
U14  AD8421  [FP-R-8-IPC_C]
U15  AD8421  [FP-R-8-IPC_C]

### Ports
+VCCb (see Sheet4[1A], Sheet4[1C], Sheet4[2A], Sheet4[2B], Sheet4[3B], Sheet4[3C], Sheet8[4B]), +VCCb (see Sheet4[1A], Sheet4[1C], Sheet4[2A], Sheet4[2B], Sheet4[3B], Sheet4[4B], Sheet8[4B]), +VCCb (see Sheet4[1A], Sheet4[1C], Sheet4[2A], Sheet4[2B], Sheet4[3C], Sheet4[4B], Sheet8[4B]), +VCCb (see Sheet4[1A], Sheet4[1C], Sheet4[2A], Sheet4[3B], Sheet4[3C], Sheet4[4B], Sheet8[4B]), +VCCb (see Sheet4[1A], Sheet4[1C], Sheet4[2B], Sheet4[3B], Sheet4[3C], Sheet4[4B], Sheet8[4B]), +VCCb (see Sheet4[1A], Sheet4[2A], Sheet4[2B], Sheet4[3B], Sheet4[3C], Sheet4[4B], Sheet8[4B]), +VCCb (see Sheet4[1C], Sheet4[2A], Sheet4[2B], Sheet4[3B], Sheet4[3C], Sheet4[4B], Sheet8[4B]), -VCCb (see Sheet4[1B], Sheet4[1D], Sheet4[2B], Sheet4[2C], Sheet4[3C], Sheet4[3D], Sheet8[3B]), -VCCb (see Sheet4[1B], Sheet4[1D], Sheet4[2B], Sheet4[2C], Sheet4[3C], Sheet4[4C], Sheet8[3B]), -VCCb (see Sheet4[1B], Sheet4[1D], Sheet4[2B], Sheet4[2C], Sheet4[3D], Sheet4[4C], Sheet8[3B]), -VCCb (see Sheet4[1B], Sheet4[1D], Sheet4[2B], Sheet4[3C], Sheet4[3D], Sheet4[4C], Sheet8[3B]), -VCCb (see Sheet4[1B], Sheet4[1D], Sheet4[2C], Sheet4[3C], Sheet4[3D], Sheet4[4C], Sheet8[3B]), -VCCb (see Sheet4[1B], Sheet4[2B], Sheet4[2C], Sheet4[3C], Sheet4[3D], Sheet4[4C], Sheet8[3B]), -VCCb (see Sheet4[1D], Sheet4[2B], Sheet4[2C], Sheet4[3C], Sheet4[3D], Sheet4[4C], Sheet8[3B]), Vb (in, see Sheet2[2B])

### Nets
GND: C18.2 J3.2(GND) U9.3(+IN) U11.3(+IN) U12.3(+IN) U13.3(+IN) U14.1(-IN) U15.1(-IN)
NetC16_1: C16.1 J18.1 U10.2(-IN) U10.6(OUT)
NetC16_2: C16.2 R42.1
NetC17_1: C17.1 J20.1 U14.7(VOUT)
NetC17_2: C17.2 R45.1
NetC18_1: C18.1 J3.1 R46.2
NetC34_1: U9.7(+V) U10.7(V+) U11.7(V+) U12.7(+V) U13.7(V+) U14.8(+VS) U15.8(+VS) ; port +VCCb
NetC35_1: U9.4(-V) U10.4(V-) U11.4(V-) U12.4(-V) U13.4(V-) U14.5(-VS) U15.5(-VS) ; port -VCCb
NetJ17_1: J17.1 R41.2 U11.6(OUT) U14.4(+IN)
NetJ19_1: J19.1 R43.2 U13.6(OUT) U15.4(+IN)
NetJ21_1: J21.1 R49.2 U12.6(OUT) U15.6(REF)
NetJ22_1: J22.1 R48.2 U9.6(OUT) U14.6(REF)
NetQ2_3: U10.3(+IN) ; port Vb
NetR41_1: R41.1 R42.2 U11.2(-IN)
NetR43_1: R43.1 R45.2 U13.2(-IN)
NetR44_1: R44.1 U14.3(2_RG)
NetR44_2: R44.2 U14.2(1_RG)
NetR46_1: R46.1 U15.7(VOUT)
NetR47_1: R47.1 U15.3(2_RG)
NetR47_2: R47.2 U15.2(1_RG)
NetR48_1: R48.1 U9.2(-IN)
NetR49_1: R49.1 U12.2(-IN)

Not connected (* = marked no-connect by the designer): J3 3(MNT_1)* 4(MNT_2)*; U9 1(NC)* 5(NC)* 8(NC)*; U10 1(NC)* 5(NC)* 8(NC)*; U11 1(NC)* 5(NC)* 8(NC)*; U12 1(NC)* 5(NC)* 8(NC)*; U13 1(NC)* 5(NC)* 8(NC)*

### Notes on the sheet
- Vb measurement circuit
- Mohammed Tuhin Rana
- (in symbol CMP-09116-000012-1) -; +

### Library data of the parts
C16 C17 = CMP-2007-03453-2: as C13 on sheet Sheet3; Radiation Hardening: No; Thickness: 0.053inch; Voltage Rating (DC): 16V; Lead Free: Lead Free; Package Quantity: 1; Width: 1.25mm; Case Code (Imperial): 0805; Depth: 1.25mm; Packaging: Tape and Reel; Dielectric: X5R; Max Operating Temperature: 85°C; Tolerance: 10%; Voltage Rating: 16V; Voltage: 16V; Capacitance: 10uF; Height: 1.25mm; Case Code (Metric): 2012; Material: Ceramic; Mount: Surface Mount; Case/Package: 0805; REACH SVHC: No SVHC; Length: 2mm; Min Operating Temperature: -55°C; Termination: SMD/SMT
C18 = CMP-1037-02920-2: as C15 on sheet Sheet3; ComponentLink2URL: https://content.kemet.com/datasheets/KEM_C1007_X8R_ULTRA_150C_SMD.pdf; Device Class L3: Ceramic Capacitors; Device Class L2: Capacitors; ComponentLink2Description: Datasheet; Automotive: Yes; Temperature Range Low: -55°C; Temperature: -55°C to +150°C; Octopart: https://octopart.com/c1206c302j5gactu-kemet-12776246; Height: 0.88mm; Lead Free: Yes; Device Class L1: Passive Components; Digikey Description: CAP CER 3000PF 50V NP0 1206; Category: Cap; Mouser Description: Capacitor, Ceramic, 3Nf, 50Vdc, 5-% Tol, 5+% Tol, C0g-Tc Code, -30, 30Ppm-Tc Rohs Compliant: Yes; RoHS: TRUE; Ipc Land Pattern Name: CAPC320160X78; Voltage Rating: 50 V; Capacitance: 3,000 pF; Temperature Range High: +150°C; Package: C1206C-EB
J3 = CMP-03790-39547162-1: as J2 on sheet Sheet3; ELV: Compliant; Lead Free: Lead Free; Radiation Hardening: No; Gender: Female; Color: Black; Mount: Panel, Through Hole; Packaging: Bulk; NexarPartId: 39547162; Housing Color: Black; Fastening Type: Bayonet; Contact Gender: Female; Lifecycle Status: Production; Depth: 34.93mm; Min Operating Temperature: -55°C; Number of Contacts: 1; RoHS: Compliant; Length: 14.76mm; Insulation Material: Polymethylpentene; Termination: Solder, Through Hole; Connector Type: BNC; Contact Plating: Gold; Max Frequency: 2GHz; Max Operating Temperature: 85°C; Height: 13.18mm; REACH SVHC: Unknown; Orientation: Right Angle; Contact Material: Copper
J17-J22 = CMP-2000-05181-2: as J6 on sheet Sheet1; Insulation Material: Nylon; Mount: Through Hole; RoHS Compliant: Yes; Series: THM; Height: 0.3inch; Termination: Through Hole; Material: Nylon; Packaging: Bulk; Contact Material: Bronze; REACH SVHC: No SVHC; Contact Plating: Silver; Orientation: Straight; Lead Free: Lead Free; Package Quantity: 100; Length: 7.62mm; Flammability Rating: UL94 V-0; Number of Contacts: 1; Diameter: 2.54mm; Housing Color: Black; Color: Black
R41-R43 R45 = CMP-2003-04406-1: as R32 on sheet Sheet3
R44 = CMP-2000-04347-2: as R35 on sheet Sheet3; Height: 0.55mm; Temperature Range Low: -55°C; Temperature Range High: +155°C; Package: RT0603; Digikey Description: RES SMD 10 OHM 0.1% 1/10W 0603; Lead Free: Yes; Ipc Land Pattern Name: RESC16080X45; Mouser Description: Thin Film Resistors - SMD 1/10W 10 ohm .1% 25ppm; Automotive: No; Footprint Url: http://www.yageo.com/exep/pages/download/literatures/PYu-R_Mount_10.pdf; Series: RT; Device Class L3: Chip SMD Resistors; Device Class L2: Resistors; Octopart: https://octopart.com/rt0603brd0710rl-yageo-1216748; Temperature: -55°C to +155°C; Composition: Thin Film; Category: Res; ComponentLink2Description: Datasheet; Device Class L1: Passive Components; RoHS: TRUE; ComponentLink2URL: http://www.yageo.com/documents/recent/PYu-RT_1-to-0.01_RoHS_L_9.pdf
R46 = CMP-2000-00870-2: as R27 on sheet Sheet2; Number of Terminations: 2; Case/Package: 0603; Termination: SMD/SMT; Number of Pins: 2; Size Code: 0603; Length: 1.6mm; Min Operating Temperature: -55°C; Resistor Type: Thin Film; Depth: 0.8mm; Military Standard: Not; Packaging: Tape and Reel; RoHS Compliant: Yes; Construction: Rectangular; Resistance Tolerance: 0.1%; Contact Plating: Tin; Width: 0.8mm; Mount: Surface Mount; Case Code (Metric): 1608; Max Operating Temperature: 155°C; Height: 0.45mm; Case Code (Imperial): 0603; Series: ERA-3A; Package Quantity: 5000; REACH SVHC: No SVHC; Tolerance: 0.1%; Max Power Dissipation: 100mW; Radiation Hardening: No; Technology: METAL FILM
R47 = CMP-05422-000155-1: RES SMD 10K OHM 1% 1/3W 0603; RoHS Compliant: Yes
R48 R49 = CMP-03412-001731-1: as R39 on sheet Sheet3; Series: RT; Mouser Description: Thin Film Resistors - SMD 1/4W 5K ohm .1% 25ppm; Temperature: -55°C to +155°C; Composition: Thin Film; Footprint Url: https://www.yageo.com/upload/website/yageo_PYu-R_Mount_10_19050818_343.pdf; Device Class L1: Passive Components; Temperature Range High: +155°C; Octopart: https://octopart.com/rt1206brd075kl-yageo-29806230; Ipc Land Pattern Name: RESC310160X55; Device Class L3: Chip SMD Resistors; Temperature Range Low: -55°C; Height: 0.65mm; ComponentLink2URL: https://www.yageo.com/upload/media/product/productsearch/datasheet/rchip/PYu-RT_1-to-0.01_RoHS_L_11.pdf; Automotive: No; Category: Res; ComponentLink2Description: Datasheet; Package: RT1206-0.65; Lead Free: Yes; Digikey Description: RES SMD 5K OHM 0.1% 1/4W 1206; Device Class L2: Resistors; RoHS: TRUE; Tolerance: 0.1%
U9 U12 = CMP-0384-00640-2: as U2 on sheet Sheet3; ComponentLink2Description: Datasheet; ComponentLink4URL: http://www.analog.com/en/all-operational-amplifiers-op-amps/operational-amplifiers-op-amps/op1177/products/product.html#product-recommendations; ComponentLink3Description: Package Specification; PackageDescription: 8-Pin Standard Small Outline Package, Body 3.9 x 4.9 mm, Pitch 1.27 mm; ComponentLink1URL: http://www.analog.com/en/index.html; PackageReference: R-8; PackageVersion: 060506-A; DatasheetVersion: Rev. G; ComponentLink4Description: Reference Circuit; ComponentLink1Description: Manufacturer URL; Mounting Technology: Surface Mount; RevisionNote: Reference Circuit URL fixed; ComponentLink3URL: http://www.analog.com/static/imported-files/packages/PKG_PDF/SOIC_Narrow%20(R)/R_8.pdf; Code_JEDEC: MS-012-AA; Slew Rate: 700mV/us; ComponentLink2URL: http://www.analog.com/static/imported-files/data_sheets/OP1177_2177_4177.pdf; Generic Part Number: OP1177
U10 U11 U13 = CMP-0359-02644-2: as U3 on sheet Sheet3; RevisionNote: URLs updated; ComponentLink2URL: http://cds.linear.com/docs/en/datasheet/620234fd.pdf; PackageDescription: 8-Pin Plastic Small Outline, Body 4.9 x 3.9 mm, Pitch 1.27 mm; Linear Technology Part Number: LT6202; RoHS: Pb-Free; ComponentLink3Description: Package Specification; ComponentLink2Description: Datasheet; PackageVersion: Rev G; ComponentLink3URL: http://cds.linear.com/docs/en/packaging/05081610_G_SO8.pdf; ComponentLink1Description: Manufacturer URL; DatasheetVersion: Rev. D; PackageReference: LT-S8-8; Mounting Technology: Surface Mount; ComponentLink1URL: http://www.linear.com/; Type: VFB
U14 U15 = CMP-09116-000012-1: as U7 on sheet Sheet3; Lead Free: Yes; Temperature: -40°C to +85°C; Device Class L1: Integrated Circuits (ICs); Temperature Range Low: -40°C; Automotive: No; RoHS: TRUE; Bandwidth: 10MHz; Package: R-8; Temperature Range High: +85°C; Octopart: https://octopart.com/ad8421arz-r7-analog+devices-21054779; Digikey Description: IC OPAMP INSTR 10MHZ 8SOIC; Device Class L2: Linear ICs; ComponentLink2Description: Datasheet; Category: IC; ComponentLink2URL: https://www.analog.com/media/en/technical-documentation/data-sheets/AD8421.pdf; Height: 1.75mm; Mouser Description: Instrumentation Amplifiers 3nV/Hz Low Power; Device Class L3: Instrumentation

## Sheet Sheet6.SchDoc
size A; SheetNumber: 5; SheetTotal: 10
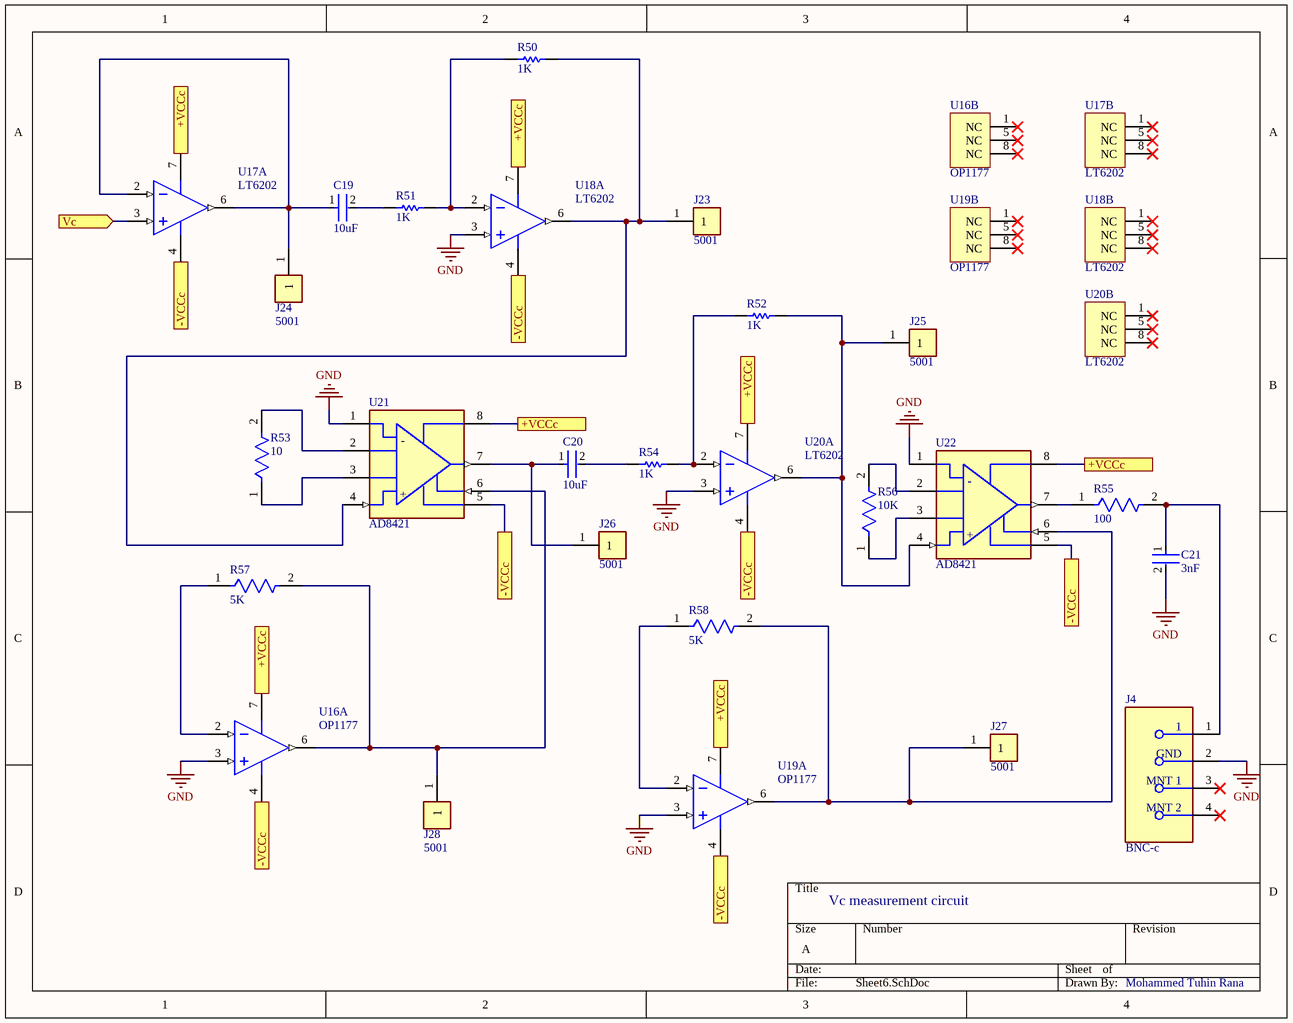
[diagram p4: Sheet6.SchDoc]

### Parts
C19  10uF  [FP-GRM21B-0_1-IPC_C]
C20  10uF  [FP-GRM21B-0_1-IPC_C]
C21  3nF  [FP-C1206C-EB-MFG]
J4  BNC-c  [FP-5413194-2-MFG]
J23  5001  [FP-5001-MFG]
J24  5001  [FP-5001-MFG]
J25  5001  [FP-5001-MFG]
J26  5001  [FP-5001-MFG]
J27  5001  [FP-5001-MFG]
J28  5001  [FP-5001-MFG]
R50  1K  [RESC3216X70X50ML20T25]
R51  1K  [RESC3216X70X50ML20T25]
R52  1K  [RESC3216X70X50ML20T25]
R53  10  [FP-RT0603-MFG]
R54  1K  [RESC3216X70X50ML20T25]
R55  100  [FP-ERA3A-IPC_B]
R56  10K  [FP-ERJPA3-IPC_A]
R57  5K  [FP-RT1206-0_65-MFG]
R58  5K  [FP-RT1206-0_65-MFG]
U16  OP1177  [ADI-R-8_N]  (parts A,B of 2)
U17  LT6202  [LT-S8-8_N]  (parts A,B of 2)
U18  LT6202  [LT-S8-8_N]  (parts A,B of 2)
U19  OP1177  [ADI-R-8_N]  (parts A,B of 2)
U20  LT6202  [LT-S8-8_N]  (parts A,B of 2)
U21  AD8421  [FP-R-8-IPC_C]
U22  AD8421  [FP-R-8-IPC_C]

### Ports
+VCCc (see Sheet6[1A], Sheet6[1C], Sheet6[2A], Sheet6[2B], Sheet6[3B], Sheet6[3C], Sheet9[4B]), +VCCc (see Sheet6[1A], Sheet6[1C], Sheet6[2A], Sheet6[2B], Sheet6[3B], Sheet6[4B], Sheet9[4B]), +VCCc (see Sheet6[1A], Sheet6[1C], Sheet6[2A], Sheet6[2B], Sheet6[3C], Sheet6[4B], Sheet9[4B]), +VCCc (see Sheet6[1A], Sheet6[1C], Sheet6[2A], Sheet6[3B], Sheet6[3C], Sheet6[4B], Sheet9[4B]), +VCCc (see Sheet6[1A], Sheet6[1C], Sheet6[2B], Sheet6[3B], Sheet6[3C], Sheet6[4B], Sheet9[4B]), +VCCc (see Sheet6[1A], Sheet6[2A], Sheet6[2B], Sheet6[3B], Sheet6[3C], Sheet6[4B], Sheet9[4B]), +VCCc (see Sheet6[1C], Sheet6[2A], Sheet6[2B], Sheet6[3B], Sheet6[3C], Sheet6[4B], Sheet9[4B]), -VCCc (see Sheet6[1B], Sheet6[1D], Sheet6[2B], Sheet6[2C], Sheet6[3C], Sheet6[3D], Sheet9[3B]), -VCCc (see Sheet6[1B], Sheet6[1D], Sheet6[2B], Sheet6[2C], Sheet6[3C], Sheet6[4C], Sheet9[3B]), -VCCc (see Sheet6[1B], Sheet6[1D], Sheet6[2B], Sheet6[2C], Sheet6[3D], Sheet6[4C], Sheet9[3B]), -VCCc (see Sheet6[1B], Sheet6[1D], Sheet6[2B], Sheet6[3C], Sheet6[3D], Sheet6[4C], Sheet9[3B]), -VCCc (see Sheet6[1B], Sheet6[1D], Sheet6[2C], Sheet6[3C], Sheet6[3D], Sheet6[4C], Sheet9[3B]), -VCCc (see Sheet6[1B], Sheet6[2B], Sheet6[2C], Sheet6[3C], Sheet6[3D], Sheet6[4C], Sheet9[3B]), -VCCc (see Sheet6[1D], Sheet6[2B], Sheet6[2C], Sheet6[3C], Sheet6[3D], Sheet6[4C], Sheet9[3B]), Vc (in, see Sheet2[3B])

### Nets
GND: C21.2 J4.2(GND) U16.3(+IN) U18.3(+IN) U19.3(+IN) U20.3(+IN) U21.1(-IN) U22.1(-IN)
NetC19_1: C19.1 J24.1 U17.2(-IN) U17.6(OUT)
NetC19_2: C19.2 R51.1
NetC20_1: C20.1 J26.1 U21.7(VOUT)
NetC20_2: C20.2 R54.1
NetC21_1: C21.1 J4.1 R55.2
NetC41_1: U16.7(+V) U17.7(V+) U18.7(V+) U19.7(+V) U20.7(V+) U21.8(+VS) U22.8(+VS) ; port +VCCc
NetC42_1: U16.4(-V) U17.4(V-) U18.4(V-) U19.4(-V) U20.4(V-) U21.5(-VS) U22.5(-VS) ; port -VCCc
NetJ23_1: J23.1 R50.2 U18.6(OUT) U21.4(+IN)
NetJ25_1: J25.1 R52.2 U20.6(OUT) U22.4(+IN)
NetJ27_1: J27.1 R58.2 U19.6(OUT) U22.6(REF)
NetJ28_1: J28.1 R57.2 U16.6(OUT) U21.6(REF)
NetQ3_3: U17.3(+IN) ; port Vc
NetR50_1: R50.1 R51.2 U18.2(-IN)
NetR52_1: R52.1 R54.2 U20.2(-IN)
NetR53_1: R53.1 U21.3(2_RG)
NetR53_2: R53.2 U21.2(1_RG)
NetR55_1: R55.1 U22.7(VOUT)
NetR56_1: R56.1 U22.3(2_RG)
NetR56_2: R56.2 U22.2(1_RG)
NetR57_1: R57.1 U16.2(-IN)
NetR58_1: R58.1 U19.2(-IN)

Not connected (* = marked no-connect by the designer): J4 3(MNT_1)* 4(MNT_2)*; U16 1(NC)* 5(NC)* 8(NC)*; U17 1(NC)* 5(NC)* 8(NC)*; U18 1(NC)* 5(NC)* 8(NC)*; U19 1(NC)* 5(NC)* 8(NC)*; U20 1(NC)* 5(NC)* 8(NC)*

### Notes on the sheet
- Vc measurement circuit
- Mohammed Tuhin Rana
- (in symbol CMP-09116-000012-1) -; +

### Library data of the parts
C19 C20 = CMP-2007-03453-2: as C13 on sheet Sheet3; Radiation Hardening: No; Thickness: 0.053inch; Voltage Rating (DC): 16V; Lead Free: Lead Free; Package Quantity: 1; Width: 1.25mm; Case Code (Imperial): 0805; Depth: 1.25mm; Packaging: Tape and Reel; Dielectric: X5R; Max Operating Temperature: 85°C; Tolerance: 10%; Voltage Rating: 16V; Voltage: 16V; Capacitance: 10uF; Height: 1.25mm; Case Code (Metric): 2012; Material: Ceramic; Mount: Surface Mount; Case/Package: 0805; REACH SVHC: No SVHC; Length: 2mm; Min Operating Temperature: -55°C; Termination: SMD/SMT
C21 = CMP-1037-02920-2: as C15 on sheet Sheet3; ComponentLink2URL: https://content.kemet.com/datasheets/KEM_C1007_X8R_ULTRA_150C_SMD.pdf; Device Class L3: Ceramic Capacitors; Device Class L2: Capacitors; ComponentLink2Description: Datasheet; Automotive: Yes; Temperature Range Low: -55°C; Temperature: -55°C to +150°C; Octopart: https://octopart.com/c1206c302j5gactu-kemet-12776246; Height: 0.88mm; Lead Free: Yes; Device Class L1: Passive Components; Digikey Description: CAP CER 3000PF 50V NP0 1206; Category: Cap; Mouser Description: Capacitor, Ceramic, 3Nf, 50Vdc, 5-% Tol, 5+% Tol, C0g-Tc Code, -30, 30Ppm-Tc Rohs Compliant: Yes; RoHS: TRUE; Ipc Land Pattern Name: CAPC320160X78; Voltage Rating: 50 V; Capacitance: 3,000 pF; Temperature Range High: +150°C; Package: C1206C-EB
J4 = CMP-03790-39547162-1: as J2 on sheet Sheet3; ELV: Compliant; Lead Free: Lead Free; Radiation Hardening: No; Gender: Female; Color: Black; Mount: Panel, Through Hole; Packaging: Bulk; NexarPartId: 39547162; Housing Color: Black; Fastening Type: Bayonet; Contact Gender: Female; Lifecycle Status: Production; Depth: 34.93mm; Min Operating Temperature: -55°C; Number of Contacts: 1; RoHS: Compliant; Length: 14.76mm; Insulation Material: Polymethylpentene; Termination: Solder, Through Hole; Connector Type: BNC; Contact Plating: Gold; Max Frequency: 2GHz; Max Operating Temperature: 85°C; Height: 13.18mm; REACH SVHC: Unknown; Orientation: Right Angle; Contact Material: Copper
J23-J28 = CMP-2000-05181-2: as J6 on sheet Sheet1; Insulation Material: Nylon; Mount: Through Hole; RoHS Compliant: Yes; Series: THM; Height: 0.3inch; Termination: Through Hole; Material: Nylon; Packaging: Bulk; Contact Material: Bronze; REACH SVHC: No SVHC; Contact Plating: Silver; Orientation: Straight; Lead Free: Lead Free; Package Quantity: 100; Length: 7.62mm; Flammability Rating: UL94 V-0; Number of Contacts: 1; Diameter: 2.54mm; Housing Color: Black; Color: Black
R50-R52 R54 = CMP-2003-04406-1: as R32 on sheet Sheet3
R53 = CMP-2000-04347-2: as R35 on sheet Sheet3; Height: 0.55mm; Temperature Range Low: -55°C; Temperature Range High: +155°C; Package: RT0603; Digikey Description: RES SMD 10 OHM 0.1% 1/10W 0603; Lead Free: Yes; Ipc Land Pattern Name: RESC16080X45; Mouser Description: Thin Film Resistors - SMD 1/10W 10 ohm .1% 25ppm; Automotive: No; Footprint Url: http://www.yageo.com/exep/pages/download/literatures/PYu-R_Mount_10.pdf; Series: RT; Device Class L3: Chip SMD Resistors; Device Class L2: Resistors; Octopart: https://octopart.com/rt0603brd0710rl-yageo-1216748; Temperature: -55°C to +155°C; Composition: Thin Film; Category: Res; ComponentLink2Description: Datasheet; Device Class L1: Passive Components; RoHS: TRUE; ComponentLink2URL: http://www.yageo.com/documents/recent/PYu-RT_1-to-0.01_RoHS_L_9.pdf
R55 = CMP-2000-00870-2: as R27 on sheet Sheet2; Number of Terminations: 2; Case/Package: 0603; Termination: SMD/SMT; Number of Pins: 2; Size Code: 0603; Length: 1.6mm; Min Operating Temperature: -55°C; Resistor Type: Thin Film; Depth: 0.8mm; Military Standard: Not; Packaging: Tape and Reel; RoHS Compliant: Yes; Construction: Rectangular; Resistance Tolerance: 0.1%; Contact Plating: Tin; Width: 0.8mm; Mount: Surface Mount; Case Code (Metric): 1608; Max Operating Temperature: 155°C; Height: 0.45mm; Case Code (Imperial): 0603; Series: ERA-3A; Package Quantity: 5000; REACH SVHC: No SVHC; Tolerance: 0.1%; Max Power Dissipation: 100mW; Radiation Hardening: No; Technology: METAL FILM
R56 = CMP-05422-000155-1: RES SMD 10K OHM 1% 1/3W 0603; RoHS Compliant: Yes
R57 R58 = CMP-03412-001731-1: as R39 on sheet Sheet3; Series: RT; Mouser Description: Thin Film Resistors - SMD 1/4W 5K ohm .1% 25ppm; Temperature: -55°C to +155°C; Composition: Thin Film; Footprint Url: https://www.yageo.com/upload/website/yageo_PYu-R_Mount_10_19050818_343.pdf; Device Class L1: Passive Components; Temperature Range High: +155°C; Octopart: https://octopart.com/rt1206brd075kl-yageo-29806230; Ipc Land Pattern Name: RESC310160X55; Device Class L3: Chip SMD Resistors; Temperature Range Low: -55°C; Height: 0.65mm; ComponentLink2URL: https://www.yageo.com/upload/media/product/productsearch/datasheet/rchip/PYu-RT_1-to-0.01_RoHS_L_11.pdf; Automotive: No; Category: Res; ComponentLink2Description: Datasheet; Package: RT1206-0.65; Lead Free: Yes; Digikey Description: RES SMD 5K OHM 0.1% 1/4W 1206; Device Class L2: Resistors; RoHS: TRUE; Tolerance: 0.1%
U16 U19 = CMP-0384-00640-2: as U2 on sheet Sheet3; ComponentLink2Description: Datasheet; ComponentLink4URL: http://www.analog.com/en/all-operational-amplifiers-op-amps/operational-amplifiers-op-amps/op1177/products/product.html#product-recommendations; ComponentLink3Description: Package Specification; PackageDescription: 8-Pin Standard Small Outline Package, Body 3.9 x 4.9 mm, Pitch 1.27 mm; ComponentLink1URL: http://www.analog.com/en/index.html; PackageReference: R-8; PackageVersion: 060506-A; DatasheetVersion: Rev. G; ComponentLink4Description: Reference Circuit; ComponentLink1Description: Manufacturer URL; Mounting Technology: Surface Mount; RevisionNote: Reference Circuit URL fixed; ComponentLink3URL: http://www.analog.com/static/imported-files/packages/PKG_PDF/SOIC_Narrow%20(R)/R_8.pdf; Code_JEDEC: MS-012-AA; Slew Rate: 700mV/us; ComponentLink2URL: http://www.analog.com/static/imported-files/data_sheets/OP1177_2177_4177.pdf; Generic Part Number: OP1177
U17 U18 U20 = CMP-0359-02644-2: as U3 on sheet Sheet3; RevisionNote: URLs updated; ComponentLink2URL: http://cds.linear.com/docs/en/datasheet/620234fd.pdf; PackageDescription: 8-Pin Plastic Small Outline, Body 4.9 x 3.9 mm, Pitch 1.27 mm; Linear Technology Part Number: LT6202; RoHS: Pb-Free; ComponentLink3Description: Package Specification; ComponentLink2Description: Datasheet; PackageVersion: Rev G; ComponentLink3URL: http://cds.linear.com/docs/en/packaging/05081610_G_SO8.pdf; ComponentLink1Description: Manufacturer URL; DatasheetVersion: Rev. D; PackageReference: LT-S8-8; Mounting Technology: Surface Mount; ComponentLink1URL: http://www.linear.com/; Type: VFB
U21 U22 = CMP-09116-000012-1: as U7 on sheet Sheet3; Lead Free: Yes; Temperature: -40°C to +85°C; Device Class L1: Integrated Circuits (ICs); Temperature Range Low: -40°C; Automotive: No; RoHS: TRUE; Bandwidth: 10MHz; Package: R-8; Temperature Range High: +85°C; Octopart: https://octopart.com/ad8421arz-r7-analog+devices-21054779; Digikey Description: IC OPAMP INSTR 10MHZ 8SOIC; Device Class L2: Linear ICs; ComponentLink2Description: Datasheet; Category: IC; ComponentLink2URL: https://www.analog.com/media/en/technical-documentation/data-sheets/AD8421.pdf; Height: 1.75mm; Mouser Description: Instrumentation Amplifiers 3nV/Hz Low Power; Device Class L3: Instrumentation